# Altium schematic sheet Microcontroller_and_Flash.SchDoc
size Legal; SheetNumber: 1; SheetTotal: 2
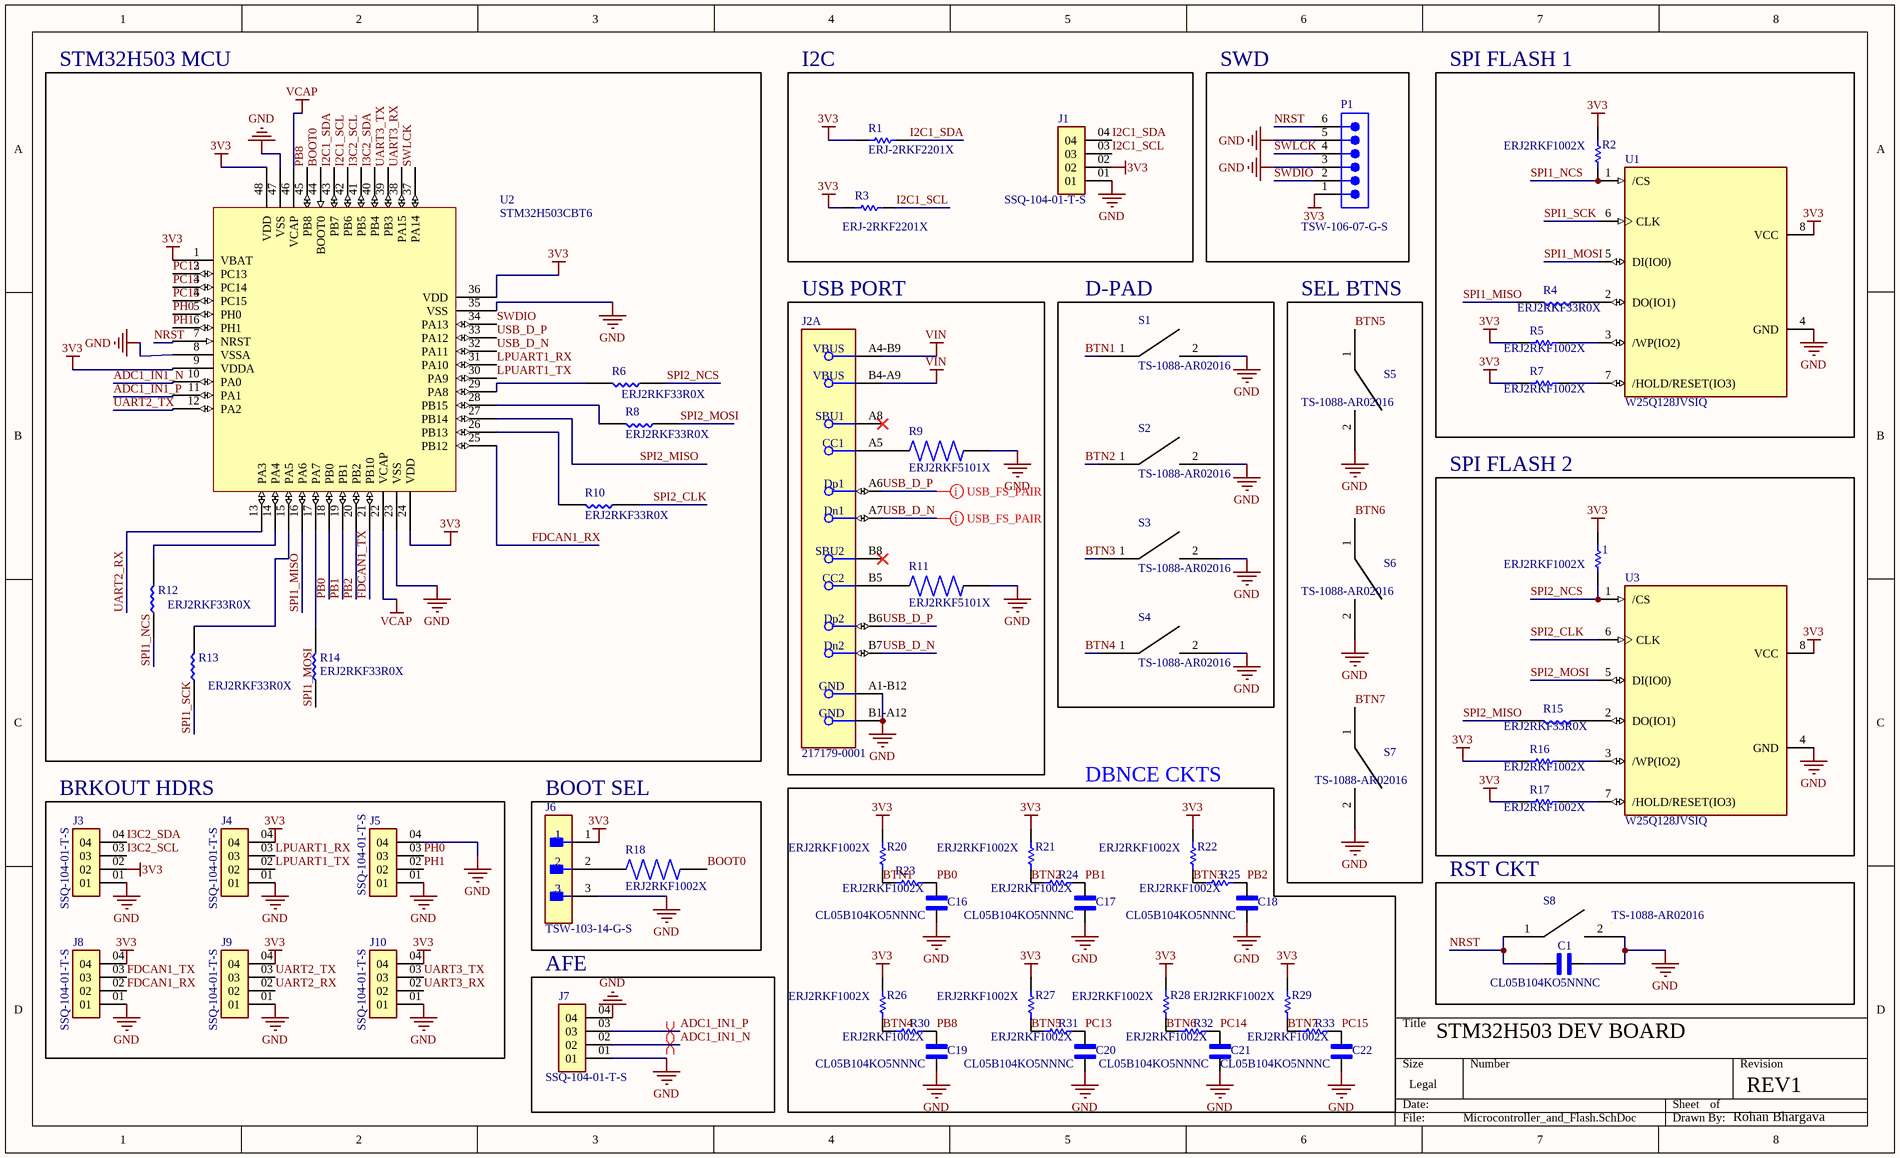
[diagram p0: Microcontroller_and_Flash.SchDoc]

## Parts
1  ERJ2RKF1002X  [RES_ERJ2RKF1002X]
C1  CL05B104KO5NNNC  [CAPC1005X55N]
C16  CL05B104KO5NNNC  [CAPC1005X55N]
C17  CL05B104KO5NNNC  [CAPC1005X55N]
C18  CL05B104KO5NNNC  [CAPC1005X55N]
C19  CL05B104KO5NNNC  [CAPC1005X55N]
C20  CL05B104KO5NNNC  [CAPC1005X55N]
C21  CL05B104KO5NNNC  [CAPC1005X55N]
C22  CL05B104KO5NNNC  [CAPC1005X55N]
J1  SSQ-104-01-T-S  [SAMTEC_SSQ-104-01-T-S]
J2  217179-0001  [FP-2171790001-MFG]  (part A of 2)
J3  SSQ-104-01-T-S  [SAMTEC_SSQ-104-01-T-S]
J4  SSQ-104-01-T-S  [SAMTEC_SSQ-104-01-T-S]
J5  SSQ-104-01-T-S  [SAMTEC_SSQ-104-01-T-S]
J6  TSW-103-14-G-S  [FP-TSW-103-14-G-S-MFG]
J7  SSQ-104-01-T-S  [SAMTEC_SSQ-104-01-T-S]
J8  SSQ-104-01-T-S  [SAMTEC_SSQ-104-01-T-S]
J9  SSQ-104-01-T-S  [SAMTEC_SSQ-104-01-T-S]
J10  SSQ-104-01-T-S  [SAMTEC_SSQ-104-01-T-S]
P1  TSW-106-07-G-S  [SMTC-TSW-106-07-X-S]
R1  ERJ-2RKF2201X  [RESC1005X40X25NL05T05]
R2  ERJ2RKF1002X  [RES_ERJ2RKF1002X]
R3  ERJ-2RKF2201X  [RESC1005X40X25ML05T05]
R4  ERJ2RKF33R0X  [RES_ERJ2RKF33R0X]
R5  ERJ2RKF1002X  [RES_ERJ2RKF1002X]
R6  ERJ2RKF33R0X  [RES_ERJ2RKF33R0X]
R7  ERJ2RKF1002X  [RES_ERJ2RKF1002X]
R8  ERJ2RKF33R0X  [RES_ERJ2RKF33R0X]
R9  ERJ2RKF5101X  [RES_ERJ2RKF5101X]
R10  ERJ2RKF33R0X  [RES_ERJ2RKF33R0X]
R11  ERJ2RKF5101X  [RES_ERJ2RKF5101X]
R12  ERJ2RKF33R0X  [RES_ERJ2RKF33R0X]
R13  ERJ2RKF33R0X  [RES_ERJ2RKF33R0X]
R14  ERJ2RKF33R0X  [RES_ERJ2RKF33R0X]
R15  ERJ2RKF33R0X  [RES_ERJ2RKF33R0X]
R16  ERJ2RKF1002X  [RES_ERJ2RKF1002X]
R17  ERJ2RKF1002X  [RES_ERJ2RKF1002X]
R18  ERJ2RKF1002X  [RES_ERJ2RKF1002X]
R20  ERJ2RKF1002X  [RES_ERJ2RKF1002X]
R21  ERJ2RKF1002X  [RES_ERJ2RKF1002X]
R22  ERJ2RKF1002X  [RES_ERJ2RKF1002X]
R23  ERJ2RKF1002X  [RES_ERJ2RKF1002X]
R24  ERJ2RKF1002X  [RES_ERJ2RKF1002X]
R25  ERJ2RKF1002X  [RES_ERJ2RKF1002X]
R26  ERJ2RKF1002X  [RES_ERJ2RKF1002X]
R27  ERJ2RKF1002X  [RES_ERJ2RKF1002X]
R28  ERJ2RKF1002X  [RES_ERJ2RKF1002X]
R29  ERJ2RKF1002X  [RES_ERJ2RKF1002X]
R30  ERJ2RKF1002X  [RES_ERJ2RKF1002X]
R31  ERJ2RKF1002X  [RES_ERJ2RKF1002X]
R32  ERJ2RKF1002X  [RES_ERJ2RKF1002X]
R33  ERJ2RKF1002X  [RES_ERJ2RKF1002X]
S1  TS-1088-AR02016  [4x3 SWT]
S2  TS-1088-AR02016  [4x3 SWT]
S3  TS-1088-AR02016  [4x3 SWT]
S4  TS-1088-AR02016  [4x3 SWT]
S5  TS-1088-AR02016  [4x3 SWT]
S6  TS-1088-AR02016  [4x3 SWT]
S7  TS-1088-AR02016  [4x3 SWT]
S8  TS-1088-AR02016  [4x3 SWT]
U1  W25Q128JVSIQ  [SOIC127P790X216-8N]
U2  STM32H503CBT6  [TSQFP50P900X900X160-48N]
U3  W25Q128JVSIQ  [SOIC127P790X216-8N]

## Blocks framed on the sheet
STM32H503 MCU: R6 R8 R10 R12-R14 U2
I2C: J1 R1 R3
SWD: P1
SPI FLASH 1: R2 R4 R5 R7 U1
USB PORT: J2 R9 R11
D-PAD: S1-S4
SEL BTNS: S5-S7
SPI FLASH 2: 1 R15-R17 U3
DBNCE CKTS: C16-C22 R20-R33
BRKOUT HDRS: J3-J5 J8-J10
BOOT SEL: J6 R18
RST CKT: C1 S8
AFE: J7

## Nets
3V3: 1.2 J1.02 J3.02 J4.04 J6.1 J8.04 J9.04 J10.04 P1.1 R1.2 R2.1 R3.2 R5.2 R7.2 R16.2 R17.2 R20.1 R21.1 R22.1 R26.1 R27.1 R28.1 R29.1 U1.8(VCC) U2.1(VBAT) U2.9(VDDA) U2.24(VDD) U2.36(VDD) U2.48(VDD) U3.8(VCC)
GND: C1.2 C16.1 C17.1 C18.1 C19.1 C20.1 C21.1 C22.1 J1.01 J2.A1-B12(GND) J2.B1-A12(GND) J3.01 J4.01 J5.01 J5.04 J6.3 J7.01 J7.04 J8.01 J9.01 J10.01 P1.3 P1.5 R9.2 R11.2 S1.2 S2.2 S3.2 S4.2 S5.2 S6.2 S7.2 S8.2 U1.4(GND) U2.8(VSSA) U2.23(VSS) U2.35(VSS) U2.47(VSS) U3.4(GND)
VCAP: U2.22(VCAP) U2.46(VCAP)
VIN: J2.A4-B9(VBUS) J2.B4-A9(VBUS)
ADC1_IN1_N: J7.02 U2.10(PA0)
ADC1_IN1_P: J7.03 U2.11(PA1)
BOOT0: R18.2 U2.44(BOOT0)
BTN1: R20.2 R23.1 S1.1
BTN2: R21.2 R24.1 S2.1
BTN3: R22.2 R25.1 S3.1
BTN4: R26.2 R30.1 S4.1
BTN5: R27.2 R31.1 S5.1
BTN6: R28.2 R32.1 S6.1
BTN7: R29.2 R33.1 S7.1
FDCAN1_RX: J8.02 U2.25(PB12)
FDCAN1_TX: J8.03 U2.21(PB10)
I2C1_SCL: J1.03 R3.1 U2.42(PB6)
I2C1_SDA: J1.04 R1.1 U2.43(PB7)
I3C2_SCL: J3.03 U2.41(PB5)
I3C2_SDA: J3.04 U2.40(PB4)
LPUART1_RX: J4.03 U2.31(PA10)
LPUART1_TX: J4.02 U2.30(PA9)
NRST: C1.1 P1.6 S8.1 U2.7(NRST)
PB0: C16.2 R23.2 U2.18(PB0)
PB1: C17.2 R24.2 U2.19(PB1)
PB2: C18.2 R25.2 U2.20(PB2)
PB8: C19.2 R30.2 U2.45(PB8)
PC13: C20.2 R31.2 U2.2(PC13)
PC14: C21.2 R32.2 U2.3(PC14)
PC15: C22.2 R33.2 U2.4(PC15)
PH0: J5.03 U2.5(PH0)
PH1: J5.02 U2.6(PH1)
SPI1_MISO: R4.2 U2.16(PA6)
SPI1_MOSI: R14.1 U1.5(DI(IO0))
SPI1_NCS: R2.2 R12.1 U1.1(/CS)
SPI1_SCK: R13.1 U1.6(CLK)
SPI2_CLK: R10.1 U3.6(CLK)
SPI2_MISO: R15.2 U2.27(PB14)
SPI2_MOSI: R8.1 U3.5(DI(IO0))
SPI2_NCS: 1.1 R6.1 U3.1(/CS)
SWDIO: P1.2 U2.34(PA13)
SWLCK: P1.4 U2.37(PA14)
UART2_RX: J9.02 U2.13(PA3)
UART2_TX: J9.03 U2.12(PA2)
UART3_RX: J10.02 U2.38(PA15)
UART3_TX: J10.03 U2.39(PB3)
USB_D_N: J2.A7(Dn1) J2.B7(Dn2) U2.32(PA11)
USB_D_P: J2.A6(Dp1) J2.B6(Dp2) U2.33(PA12)
NetJ2_A5: J2.A5(CC1) R9.1
NetJ2_B5: J2.B5(CC2) R11.1
NetJ6_2: J6.2 R18.1
NetR4_1: R4.1 U1.2(DO(IO1))
NetR5_1: R5.1 U1.3(/WP(IO2))
NetR6_2: R6.2 U2.29(PA8)
NetR7_1: R7.1 U1.7(/HOLD/RESET(IO3))
NetR8_2: R8.2 U2.28(PB15)
NetR10_2: R10.2 U2.26(PB13)
NetR12_2: R12.2 U2.14(PA4)
NetR13_2: R13.2 U2.15(PA5)
NetR14_2: R14.2 U2.17(PA7)
NetR15_1: R15.1 U3.2(DO(IO1))
NetR16_1: R16.1 U3.3(/WP(IO2))
NetR17_1: R17.1 U3.7(/HOLD/RESET(IO3))

Not connected (* = marked no-connect by the designer): J2 A8(SBU1)* B8(SBU2)*

## Layout directives
differential pair: ADC1_IN1_N, ADC1_IN1_P, USB_D_N, USB_D_P

## Notes on the sheet
- STM32H503 DEV BOARD
- REV1
- Rohan Bhargava

## Library data of the parts
1 R2 R5 R7 R16 R17 R20-R33 = CMP-2000-07588-1: Chip Resistor, 10 KOhm, +/- 1%, 0.1 W, -55 to 155 degC, 0402 (1005 Metric), RoHS, Tape and Reel; Manufacturer: Panasonic; Power Rating: 100mW; Voltage Rating: 50V; Resistance: 10KOhm; Case\/Package: 0402; Temperature Coefficient: 100ppm\/degreesC; RoHSCompliant: True; Lead Free: LeadFree; Package Quantity: 1; Contact Plating: Tin; Length: 1mm; Radiation Hardening: No; REACH SVHC: NoSVHC; Max Operating Temperature: 155degC; Depth: 0.5mm; Case Code (Imperial): 0402; Military Standard: Not; Package Description: 2-Pin Surface Mount Device, Body 1 x 0.5 mm; Termination: SMD/SMT; Case Code (Metric): 1005; Height: 0.35mm; Packaging: TapeandReel; Voltage Rating (DC): 50V; Package Reference: 402; Number of Pins: 2; Tolerance: 1%; Mounting Technology: SurfaceMount; Width: 0.02inch; Mount: SurfaceMount; Datasheet URL: https://industrial.panasonic.com/cdbs/www-data/pdf/RDA0000/AOA0000C304.pdf; Composition: ThickFilm; Datasheet Version: 02/2017; Manufacturer URL: http://www.panasonic.com/; Max Power Dissipation: 100mW; Number of Terminations: 2; Min Operating Temperature: -55degC
C1 C16-C22 = CL05B104KO5NNNC: 0.1 ÂµF Â±10% 16V Ceramic Capacitor X7R 0402 (1005 Metric); MF: Samsung; SnapEDA_Link: https://www.snapeda.com/parts/CL05B104KO5NNNC/Samsung/view-part/?ref=snap; Package: SMD-2 Samsung; Value: *; MP: CL05B104KO5NNNC; Check_prices: https://www.snapeda.com/parts/CL05B104KO5NNNC/Samsung/view-part/?ref=eda
J1 J3-J5 J7-J10 = SSQ-104-01-T-S: MF: Samtec Inc.; Availability: Unavailable; Value: *; Package: None; Price: None; MP: SSQ-104-01-T-S
J2 = CMP-04767-000028-2: CONN RCP USB2.0 TYP C 24P SMD RA; NexarPartId: 117190526; Gender: Receptacle; Number of Contacts: 16; Current Rating: 1.25A; Voltage Rating: 30V; Min Operating Temperature: -40°C; USB Standard: USB 2.0; Height: 3.36mm; Contact Material: Gold, Nickel; Max Operating Temperature: 85°C
J6 = CMP-02766-001743-1: CONN HEADER VERT 3POS 2.54MM; Max Voltage Rating (AC): 550V; Number of Positions: 3; Max Current Rating: 7.6A; Gender: Male; Termination: Solder; RoHS Compliant: Yes; Mount: Through Hole; Lead Free: Lead Free; Connector Type: Header; REACH SVHC: No SVHC; Insulation Color: Black; Width: 2.54mm; Length: 7.62mm; Flammability Rating: UL94 V-0; Housing Material: Polyester; Contact Material: Bronze; Max Operating Temperature: 125°C; Fastening Type: Pull; Series: TSW; Number of Contacts: 3; Packaging: Bulk; Min Operating Temperature: -55°C; Package Quantity: 1; Height: 10.67mm; Pitch: 2.54mm; Contact Finish - Mating: GOLD; Contact Type: Male Pin; Radiation Hardening: No; Color: Black; Housing Color: Black; Contact Plating: Gold; Orientation: Straight; Number of Rows: 1; Depth: 2.54mm; Insulation Material: PBT; Contact Mating Length: 0.32inch; Contact Shape: Square
P1 = CMP-1024-00383-1: 0.025" SQ Post Header, Through-hole, Vertical, -55 to 125 degC, 2.54 mm Pitch, 6-Pin, Male, RoHS; Manufacturer: Samtec; Pitch: 2.54 mm; RoHS: True; ComponentLink1Description: Manufacturer URL; DatasheetVersion: F-214; Orientation: Vertical; ComponentLink1URL: http://www.samtec.com; ComponentLink3Description: Package Specification; ComponentLink2Description: Datasheet; PackageVersion: DM, 8/1988; PackageDescription: .025[0.64] SQ. Post Terminal Strip Assembly; PackageReference: TSW-106-07-X-S; Mounting Technology: Through-hole; Temperature Range: -55 to 125 degC; ComponentLink3URL: http://www.samtec.com/documents/webfiles/cpdf/TSW-XXX-XX-XXX-X-XX-XXX-MKT.pdf; ComponentLink2URL: http://www.samtec.com/documents/webfiles/pdf/TSW_TH.PDF; PartNumber: TSW-106-07-G-S
R1 R3 = CMP-2002-01132-2: Precision Thick Film Chip Resistor, 2.2 kOhm, 100 mW, 1%, -55 to 155 degC, 2-Pin SMD (0402), RoHS, Tape and Reel; Manufacturer: Panasonic; Resistance: 2.2kO; Temp Coefficient: ±100ppm/°C; Rated Power: 0.1W; Datasheet URL: https://datasheet.ciiva.com/11821/0900766b80f80784-11821273.pdf; Tolerance (%): ±1%; Mounting Technology: SurfaceMount; Package Description: 2-Pin Surface Mount Device, Body 1 x 0.5 mm; Manufacturer URL: http://www.panasonic.com/; Datasheet Version: 03/2011; Package Reference: 0402; Size Code: 0402
R4 R6 R8 R10 R12-R15 = ERJ2RKF33R0X: 33 Ohms 1% 0.1W, 1/10W Chip Resistor 0402 (1005 Metric) Automotive AEC-Q200 Thick Film; MF: Panasonic Electronic; MP: ERJ-2RKF33R0X; Package: 1005-2 Panasonic; Price: None; Check_prices: https://www.snapeda.com/parts/ERJ-2RKF33R0X/Panasonic%20Electronic%20Components/view-part/357347/?ref=eda; Value: *; SnapEDA_Link: https://www.snapeda.com/parts/ERJ-2RKF33R0X/Panasonic%20Electronic%20Components/view-part/357347/?ref=snap; Availability: In Stock
R18 = ERJ2RKF1002X: 10 kOhms 1% 0.1W, 1/10W Chip Resistor 0402 (1005 Metric) Automotive AEC-Q200 Thick Film; MF: Panasonic; MP: ERJ-2RKF1002X; Package: 1005-2 Panasonic; Price: None; Check_prices: https://www.snapeda.com/parts/ERJ-2RKF1002X/Panasonic%20Electronic%20Components/view-part/78636/?ref=eda; Value: *; SnapEDA_Link: https://www.snapeda.com/parts/ERJ-2RKF1002X/Panasonic%20Electronic%20Components/view-part/78636/?ref=snap; Availability: In Stock
U1 U3 = W25Q128JVSIQ: FLASH - NOR Memory IC 128Mb (16M x 8) SPI - Quad I/O, QPI, DTR 133 MHz 8-SOIC; MF: Winbond Electronics; SnapEDA_Link: https://www.snapeda.com/parts/W25Q128JVSIQ/Winbond/view-part/?ref=snap; Package: SOIC-8 Winbond Electronics; Value: *; MP: W25Q128JVSIQ; Check_prices: https://www.snapeda.com/parts/W25Q128JVSIQ/Winbond/view-part/?ref=eda
R9 R11 = ERJ2RKF5101X: Price: None; Value: *; Package: None; Availability: Unavailable; MP: ERJ2RKF5101X